# Altium schematic sheet RTC.SchDoc: RTC
size A4; DocumentNumber: 12; SheetNumber: 10; SheetTotal: 16
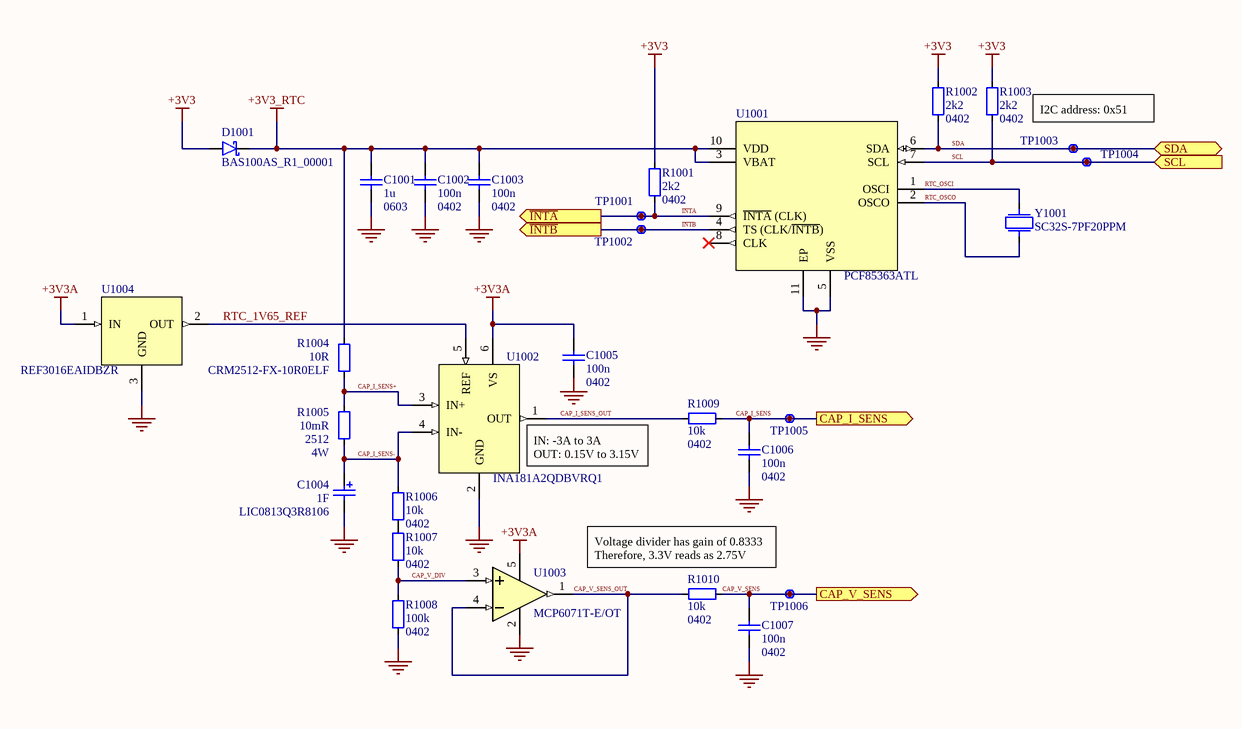
[diagram p0: RTC.SchDoc]

## Parts
C1001  1u  Footprint: 0603  [CAP_0603_B]
C1002  100n  Footprint: 0402  [CAP_0402_B]
C1003  100n  Footprint: 0402  [CAP_0402_B]
C1004  1F  [LIC0813Q3R8106]
C1005  100n  Footprint: 0402  [CAP_0402_B]
C1006  100n  Footprint: 0402  [CAP_0402_B]
C1007  100n  Footprint: 0402  [CAP_0402_B]
D1001  BAS100AS_R1_00001  [BAS100AS_R1_00001]
R1001  2k2  Footprint: 0402  [RES_0402_A]
R1002  2k2  Footprint: 0402  [RES_0402_A]
R1003  2k2  Footprint: 0402  [RES_0402_A]
R1004  10R  [CRM2512-FX-10R0ELF]
R1005  10mR  Footprint: 2512  Power: 4W  [VMS-R010-1.0-U]
R1006  10k  Footprint: 0402  [RES_0402_A]
R1007  10k  Footprint: 0402  [RES_0402_A]
R1008  100k  Footprint: 0402  [RES_0402_A]
R1009  10k  Footprint: 0402  [RES_0402_A]
R1010  10k  Footprint: 0402  [RES_0402_A]
TP1001  Net  [Unlabelled Testpoint]  (value not drawn)
TP1002  Net  [Unlabelled Testpoint]  (value not drawn)
TP1003  Net  [Unlabelled Testpoint]  (value not drawn)
TP1004  Net  [Unlabelled Testpoint]  (value not drawn)
TP1005  Net  [Unlabelled Testpoint]  (value not drawn)
TP1006  Net  [Unlabelled Testpoint]  (value not drawn)
U1001  PCF85363ATL  [PCF85363ATL/AX]
U1002  INA181A2QDBVRQ1  [INA181A2QDBVRQ1]
U1003  MCP6071T-E/OT  [MCP6071T-E/OT]
U1004  REF3016EAIDBZR  [REF3016EAIDBZR]
Y1001  SC32S-7PF20PPM  [SC32S-7PF20PPM]

## Ports
CAP_I_SENS (out, see Top_Level[3C], MCU[2D]), CAP_V_SENS (out, see Top_Level[3C], MCU[2D]), SCL (in, see Top_Level[3B]), SDA (bidir, see Top_Level[3B]), ~{INTA} (out, see Top_Level[3B]), ~{INTB} (out, see Top_Level[3C])

## Nets
+3V3: D1001.1(a) R1001.1(a) R1002.1(a) R1003.1(a)
+3V3_RTC: C1001.1 C1002.1 C1003.1 D1001.2 R1004.1(a) U1001.3(VBAT) U1001.10(VDD)
+3V3A: C1005.1 U1002.6(VS) U1003.5(VDD) U1004.1(IN)
GND: C1001.2 C1002.2 C1003.2 C1004.2 C1005.2 C1006.2 C1007.2 R1008.2(a) U1001.5(VSS) U1001.11(EP) U1002.2(GND) U1003.2(VSS) U1004.3(GND)
CAP_I_SENS: C1006.1 R1009.2(a) TP1005.1 ; port CAP_I_SENS
CAP_I_SENS+: R1004.2(a) R1005.2(a) U1002.3(IN+)
CAP_I_SENS-: C1004.1 R1005.1(a) R1006.1(a) U1002.4(IN-)
CAP_I_SENS_OUT: R1009.1(a) U1002.1(OUT)
CAP_V_DIV: R1007.2(a) R1008.1(a) U1003.3(VIN+)
CAP_V_SENS: C1007.1 R1010.2(a) TP1006.1 ; port CAP_V_SENS
CAP_V_SENS_OUT: R1010.1(a) U1003.1(VOUT) U1003.4(VIN-)
~{INT}A: R1001.2(a) TP1001.1 U1001.9(~{INTA}_(CLK)) ; port ~{INTA}
~{INT}B: TP1002.1 U1001.4(TS_(CLK/~{INTB})) ; port ~{INTB}
RTC_1V65_REF: U1002.5(REF) U1004.2(OUT)
RTC_OSCI: U1001.1(OSCI) Y1001.2
RTC_OSCO: U1001.2(OSCO) Y1001.1
SCL: R1003.2(a) TP1004.1 U1001.7(SCL) ; port SCL
SDA: R1002.2(a) TP1003.1 U1001.6(SDA) ; port SDA
NetR1006_2: R1006.2(a) R1007.1(a)

Not connected (* = marked no-connect by the designer): U1001 8(CLK)*

## Notes on the sheet
- I2C address: 0x51
- (near U1002) IN: -3A to 3A
  OUT: 0.15V to 3.15V
- Voltage divider has gain of 0.8333
  Therefore, 3.3V reads as 2.75V

## Library data of the parts
C1001 = CAP_0603: 0603 SMD Capacitor
C1002 C1003 C1005-C1007 = CAP_0402: 0402 SMD Capacitor
C1004 = CAP_GENERIC_POLARISED: 10 F (EDLC) Supercapacitor 3.8 V Radial, Can 510mOhm @ 1kHz 1000 Hrs @ 85°C; Part Number: LIC0813Q3R8106
D1001 = BAS100AS_R1_00001: DIODE SCHOTTKY 100V 500MA SOD123; Supplier 1: DigiKey; Supplier Part Number 1: 3757-BAS100AS_R1_00001CT-ND
R1001-R1003 R1006-R1010 = RES_0402: 0402 SMD Resistor
R1004 = RES_GENERIC: Generic resistor symbol; Part Number: CRM2512-FX-10R0ELF
R1005 = RES_GENERIC: VMS-R010-1.0-U; Supplier 1: DigiKey; Supplier Part Number 1: 4423-VMS-R010-1.0-UDKR-ND
TP1001-TP1006 = Unlabelled Testpoint: Symbol for an unlabelled testpoint
U1001 = PCF85363ATL: IC RTC CLK/CALENDAR I2C 10DFN; Supplier 1: Arrow Electronics; Supplier Part Number 1: PCF85363ATL/AX
U1002 = INA181A2QDBVRQ1: Current Sense Amplifier 1 Circuit Rail-to-Rail SOT-23-6; Supplier 1: DigiKey; Supplier Part Number 1: 296-INA181A2QDBVRQ1CT-ND
U1003 = MCP6071T-E/OT: Standard (General Purpose) Amplifier 1 Circuit Rail-to-Rail SOT-23-5; Supplier 1: Arrow Electronics; Supplier Part Number 1: MCP6071T-E/OT
U1004 = REF3016EAIDBZR: Series Voltage Reference IC Fixed 1.65V V ±0.1% 25 mA SOT-23-3; Supplier 1: DigiKey; Supplier Part Number 1: 296-REF3016EAIDBZRCT-ND
Y1001 = SC32S-7PF20PPM: 32.768 kHz ±20ppm Crystal 7pF 70 kOhms 2-SMD, No Lead; Supplier 1: Arrow Electronics; Supplier Part Number 1: SC32S-7PF20PPM